# Altium project Acapulko_Guitar_Pedal.PrjPcb
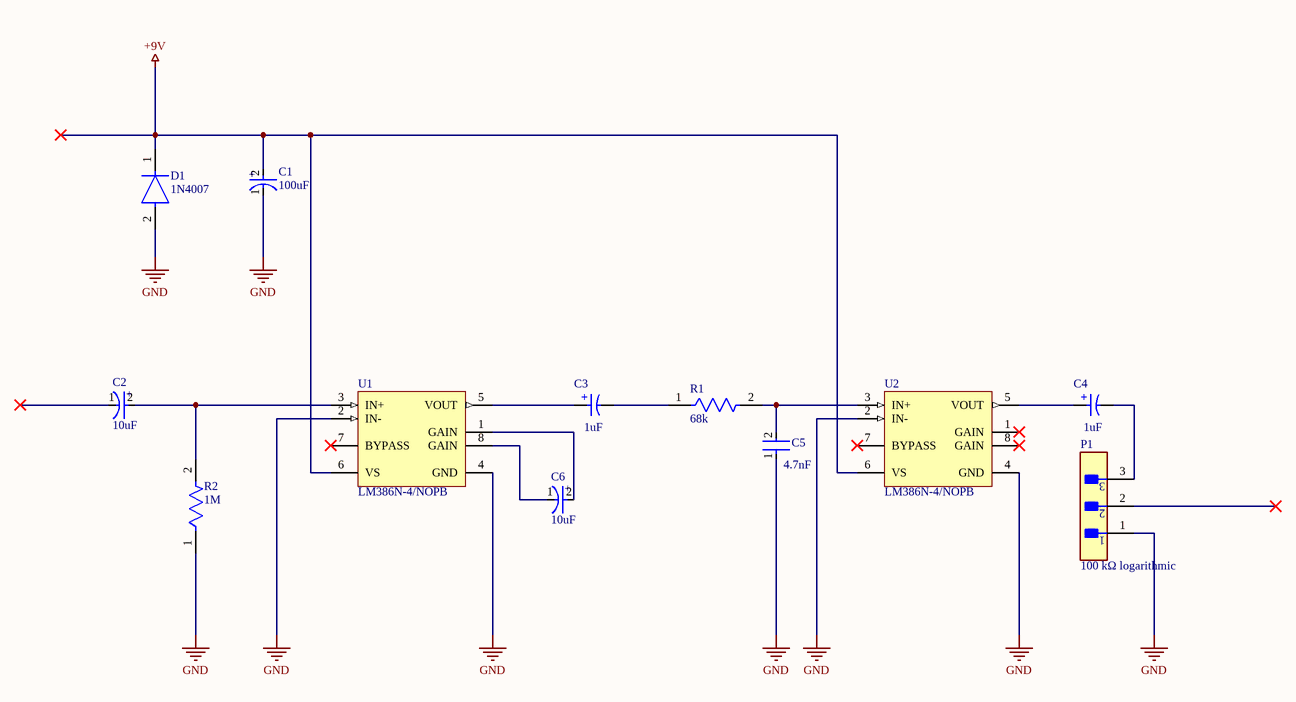
[diagram p0: AcapulcoSchem.SchDoc]
1 sheet, 12 parts. Net scope: global (net labels, ports and power ports of the same name join across sheets).
Board file: AcapulcoPCB.PcbDoc

## Sheet AcapulcoSchem.SchDoc
size A4; SheetNumber: 1; SheetTotal: 1

### Parts
C1  100uF  [FP-RAD-TH-D_6_3_0_5-L_7_1-MFG]
C2  10uF  [FP-RAD-TH-D_5_0_5-L_11_1-MFG]
C3  1uF  [WCAP-ATG5_D5H11]
C4  1uF  [WCAP-ATG5_D5H11]
C5  4.7nF  [FP-PME271Y447MR30-MFG]
C6  10uF  [FP-RAD-TH-D_5_0_5-L_11_1-MFG]
D1  1N4007  [FP-1N4007-MFG]
P1  100 kΩ logarithmic  [FP-216571-3003-MFG]
R1  68k  [FP-CFR-25-MFG]
R2  1M  [FP-CFR-25-MFG]
U1  LM386N-4/NOPB  [P0008A]
U2  LM386N-4/NOPB  [P0008A]

### Nets
+9V: C1.2(A) D1.1(C) U1.6(VS) U2.6(VS)
GND: C1.1(C) C5.1 D1.2(A) P1.1 R2.1 U1.2(IN-) U1.4(GND) U2.2(IN-) U2.4(GND)
NetC2_2: C2.2(A) R2.2 U1.3(IN+)
NetC3_1: C3.1(P) U1.5(VOUT)
NetC3_2: C3.2(N) R1.1
NetC4_1: C4.1(P) U2.5(VOUT)
NetC4_2: C4.2(N) P1.3
NetC5_2: C5.2 R1.2 U2.3(IN+)
NetC6_1: C6.1(C) U1.8(GAIN)
NetC6_2: C6.2(A) U1.1(GAIN)

Not connected (* = marked no-connect by the designer): C2 1(C)*; P1 2*; U1 7(BYPASS)*; U2 1(GAIN)* 7(BYPASS)* 8(GAIN)*

### Notes on the sheet
- (in symbol CMP-03913-53914248-2) +
- (in symbol CMP-05427-000651-1) +
- (in symbol CMP-05427-001316-1) +

### Library data of the parts
C1 = CMP-05427-001316-1: Aluminum Electrolytic Capacitors (Radial Lead Type) 100uF ±20% 16V; Life (Hours): 1000Hour; Lead Diameter: 0.45mm; Polarity: Polar; Ripple Current: 91mA; Series: KA; Packaging: Tape and Reel; Voltage Rating: 16V; Voltage Rating (DC): 16V; Min Operating Temperature: -40°C; Lead Pitch: 2.5mm; Mount: Through Hole; Height - Seated (Max): 0.315inch; Package Quantity: 2000; Length: 7mm; Termination: Radial; Voltage: 16V; Diameter: 6.3mm; Height: 7mm; Radiation Hardening: No; RoHS Compliant: Yes; Tolerance: 20%; Capacitance: 100uF; Case/Package: Radial; Max Operating Temperature: 85°C
C2 C6 = CMP-05427-000651-1: Aluminum Electrolytic Capacitors (Radial Lead Type) 10uF ±20% 50V; Lead/Base Style: Straight; Ripple Current: 250mA; Life (Hours): 5000Hour; Dissipation Factor: 0.1%; Voltage Rating (DC): 50V; Termination: Radial; Capacitance: 10uF; Length: 11mm; RoHS Compliant: Yes; Max Operating Temperature: 105°C; Package Quantity: 2000; Lead Pitch: 2mm; Series: FR; Diameter: 5mm; Case/Package: Radial; Tolerance: 20%
C3 C4 = CMP-03913-53914248-2: Alum. Electrolytic Cap 1UF 63V 5MM Radial WCAP-ATG5 Series Lifetime 2000H +105OC; Polarity: Polar; Life (Hours): 2000hours; Capacitance: 1µF; Tolerance: 20%; Leakage Current: 3µA; Material: Aluminium; Ripple Current: 13mA; Pitch: 2mm; Min Operating Temperature: -40°C; Voltage Rating (DC): 63V; Height: 11mm; RoHS: Compliant; Height - Seated (Max): 12.4968mm; REACH SVHC: Unknown; Max Operating Temperature: 105°C; Diameter: 5mm; Voltage Rating: 63V; Case/Package: Radial; Length: 11mm; Lead Pitch: 2.0066mm; Packaging: Tape & Box (TB); Mount: Through Hole
C5 = CMP-03022-000022-1: CAP FILM 4700PF 20% 1KVDC RADIAL; Voltage Rating (AC): 250V; Voltage Rating (DC): 1kV; Lead Length: 30mm; Voltage Rating: 300V; Lead/Base Style: Straight; Dielectric Material: Paper; Lead Diameter: 0.6mm; Insulation Resistance: 12GR; Series: PME271Y; RoHS Compliant: Yes; Number of Pins: 2; Length: 13.5mm; Mount: Through Hole; Construction: RADIAL; Depth: 5.1mm; Tolerance: 20%; Weight: 0.042329oz; Min Operating Temperature: -40°C; Termination: Radial; Package Quantity: 800; Voltage: 250V; Packaging: Bulk; Capacitance: 4.7nF; Height: 10.5mm; Max Operating Temperature: 100°C; Height - Seated (Max): 0.413inch; Lead Pitch: 10.2mm; Case/Package: Radial; Radiation Hardening: No; Width: 5.1mm
D1 = CMP-123542-000001-1: Rectifier diode 1000 V 1 A DO-41, ,; Manufacturer: Diotec; Max Surge Forward Current: 27A; Forward Current: 1A; Max Junction Temp: +175°C; Reverse Voltage: 1000V; Value: 15pF; Peak Reverse Current: 5uA; Category: Diode; Temperature Range Low: -50°C; Automotive: No; Temperature: -50°C to +175°C; Lead Free: Yes; ComponentLink2Description: Datasheet; Max Repetitive Reverse Voltage: 1000V; ComponentLink2URL: https://datasheet.octopart.com/1N4007-Diotec-datasheet-62346875.pdf; Manufacturer Part Number: 1N4007; Device Class L3: Rectifier Diodes; Height: 2.8mm; Octopart: https://octopart.com/1n4007-diotec-4040411; Package: 1N4007; Temperature Range High: +175°C; Device Class L1: Discrete Semiconductors; Device Class L2: Diodes; RoHS: TRUE; Capacitance: 15pF; Ipc Land Pattern Name: DIOAD888W100L520D280
P1 = CMP-04776-000396-1: MICRO-FIT PLUS SR VT HDR ASSY 30
R1 R2 = CMP-03413-000009-1: RES 10 OHM 1/4W 5% AXIAL; Resistance: 10R; Temperature Coefficient: 500ppm/°C; Max Power Dissipation: 250mW; RoHS Compliant: Yes; Packaging: Bulk; Series: Carbon Film; Case/Package: Axial; Max Operating Temperature: 155°C; Min Operating Temperature: -55°C; Number of Terminations: 2; Length: 0.248inch; Resistor Type: Carbon Film; Tolerance: 5%; Package Quantity: 200
U1 U2 = CMP-0057-00047-4: Low Voltage Audio Power Amplifier, 8-pin MDIP, Pb-Free; Manufacturer: Texas Instruments; PowerWise: N; CompType: Audio IC; PackageTopMarking: NSUZXYTTE#*LM*386N-4; PackageDescription: MDIP, .365 x .250 x .130in, 8 Lead, .100in Pitch; ComponentLink1Description: Datasheet URL; PinCount: 8; ComponentLink1URL: http://www.ti.com/general/docs/lit/getliterature.tsp?genericPartNumber=LM386&fileType=pdf; PackageReference: P0008A; RoHS: Y; Code_JEDEC: MS-001-BA